# Altium project PowerCutMonitor-v1.1.PrjPcb (part 1 of 2)
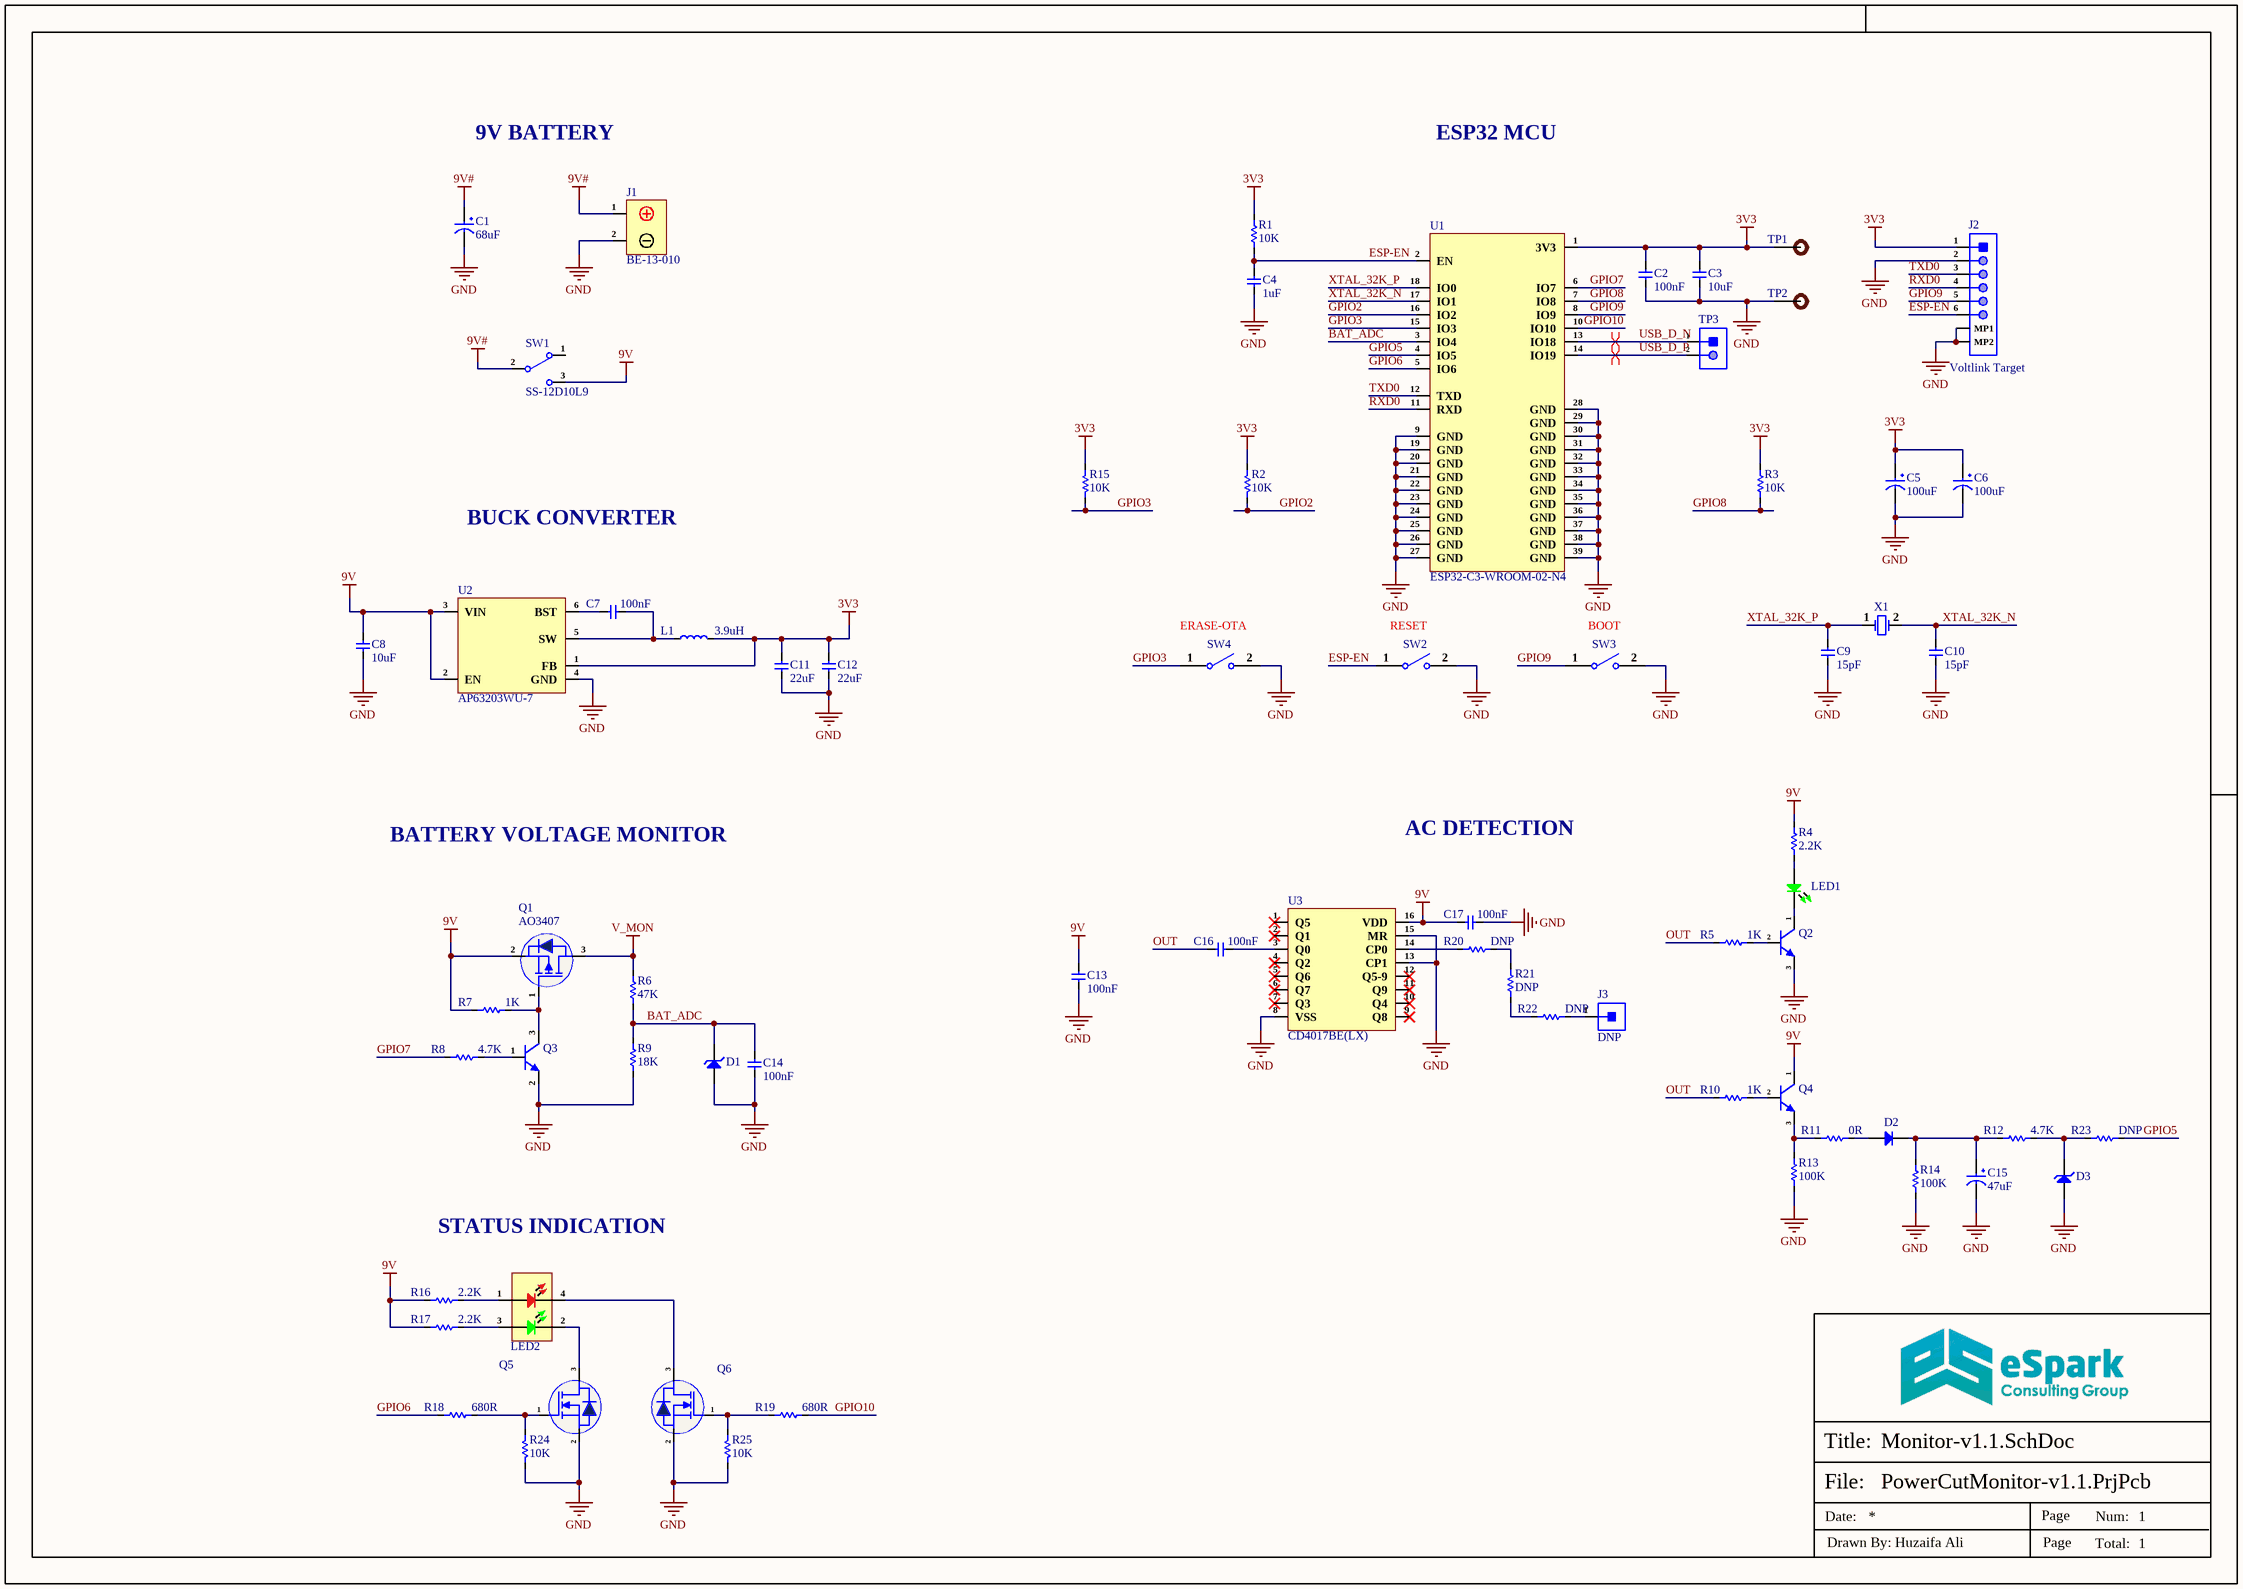
[diagram p0: Monitor-v1.1.SchDoc]
1 sheet, 68 parts. Net scope: global (net labels, ports and power ports of the same name join across sheets).
Board file: MonitorPCB-v1.1.PcbDoc

## Sheet Monitor-v1.1.SchDoc
size 420 x 297 mm; SheetNumber: 1; SheetTotal: 1

### Parts
C1  68uF  [Case-C]
C2  100nF  [cap-0402]
C3  10uF  [Cap-0402]
C4  1uF  [Cap-0402]
C5  100uF  [Case-B]
C6  100uF  [Case-B]
C7  100nF  [cap-0402]
C8  10uF  [Cap-1206]
C9  15pF  [Cap-0402]
C10  15pF  [Cap-0402]
C11  22uF  [Cap-0805]
C12  22uF  [Cap-0805]
C13  100nF  [cap-0402]
C14  100nF  [cap-0402]
C15  47uF  [Case-B]
C16  100nF  [cap-0402]
C17  100nF  [cap-0402]
D1  MM3Z3V3B  [SOD323F]  (value not drawn)
D2  1N4148WS-7-F  [SOD-323]  (value not drawn)
D3  MM3Z3V3B  [SOD323F]  (value not drawn)
J1  BE-13-010  [BE-13-010]
J2  Voltlink Target  [Voltlink Target]
J3  DNP  [HDR 1x1 TH Male]  (no BOM)
L1  3.9uH  [SWPA5020S3R9NT]
LED1  Emerald  [LED-0603]  (value not drawn)
LED2  A-SC6302R6AGHC-A03-2T  [A-SC6302R6AGHC-A03-2T]  (value not drawn)
Q1  AO3407  [SOT-23]
Q2  BC547BTA  [TO-92-3L]  (value not drawn)
Q3  MMBT3904M  [SOT-723]  (value not drawn)
Q4  BC547BTA  [TO-92-3L]  (value not drawn)
Q5  AO3400A  [sot-23]  (value not drawn)
Q6  AO3400A  [sot-23]  (value not drawn)
R1  10K  [Res-0402]
R2  10K  [Res-0402]
R3  10K  [Res-0402]
R4  2.2K  [Res-0402]
R5  1K  [Res-0402]
R6  47K  [Res-0402]
R7  1K  [Res-0402]
R8  4.7K  [Res-0402]
R9  18K  [Res-0402]
R10  1K  [Res-0402]
R11  0R  [Res-0402]  (no BOM)
R12  4.7K  [Res-0402]
R13  100K  [Res-0402]
R14  100K  [Res-0402]
R15  10K  [Res-0402]
R16  2.2K  [Res-0402]
R17  2.2K  [Res-0402]
R18  680R  [Res-0402]
R19  680R  [Res-0402]
R20  DNP  [Res-0402]  (no BOM)
R21  DNP  [Res-0402]  (no BOM)
R22  DNP  [Res-0402]  (no BOM)
R23  DNP  [Res-0402]  (no BOM)
R24  10K  [Res-0402]
R25  10K  [Res-0402]
SW1  SS-12D10L9  [SS-12D10L9]
SW2  B3U-1000P  [B3U-1000P]  (value not drawn)
SW3  B3U-1000P  [B3U-1000P]  (value not drawn)
SW4  B3U-1000P  [B3U-1000P]  (value not drawn)
TP1  TEST POINT 0.5mm Dia  [Test-point - 0.5mm]  (value not drawn)  (no BOM)
TP2  TEST POINT 0.5mm Dia  [Test-point - 0.5mm]  (value not drawn)  (no BOM)
TP3  2 Test Pad  [2 Test Pad]  (value not drawn)  (no BOM)
U1  ESP32-C3-WROOM-02-N4  [ESP32-C3-WROOM-02-N4]
U2  AP63203WU-7  [TSOT-23-6]
U3  CD4017BE(LX)  [DIP-16]
X1  Q13FC13500004  [SMD3215-2P]  (value not drawn)

### Nets
3V3: C2.2 C3.2 C5.1 C6.1 C11.2 C12.2 J2.1 L1.2 R1.2 R2.2 R3.2 R15.2 TP1.1 U1.1(3V3) U2.1(FB)
9V: C8.2 C13.2 C17.2 Q1.2(S) Q4.1(C) R4.2 R7.1 R16.1 R17.1 SW1.3 U2.2(EN) U2.3(VIN) U3.16(VDD)
9V#: C1.1 J1.1(+) SW1.2
GND: C1.2 C2.1 C3.1 C4.1 C5.2 C6.2 C8.1 C9.1 C10.1 C11.1 C12.1 C13.1 C14.1 C15.2 C17.1 D1.1(A) D3.1(A) J1.2(-) J2.2 J2.MP1 J2.MP2 Q2.3(E) Q3.2(E) Q5.2(S) Q6.2(S) R9.1 R13.1 R14.1 R24.1 R25.1 SW2.2 SW3.2 SW4.2 TP2.1 U1.9(GND) U1.19(GND) U1.20(GND) U1.21(GND) U1.22(GND) U1.23(GND) U1.24(GND) U1.25(GND) U1.26(GND) U1.27(GND) U1.28(GND) U1.29(GND) U1.30(GND) U1.31(GND) U1.32(GND) U1.33(GND) U1.34(GND) U1.35(GND) U1.36(GND) U1.37(GND) U1.38(GND) U1.39(GND) U2.4(GND) U3.8(VSS) U3.13(CP1) U3.15(MR)
V_MON: Q1.3(D) R6.2
BAT_ADC: C14.2 D1.2(K) R6.1 R9.2 U1.3(IO4)
ESP-EN: C4.2 J2.6 R1.1 SW2.1 U1.2(EN)
GPIO2: R2.1 U1.16(IO2)
GPIO3: R15.1 SW4.1 U1.15(IO3)
GPIO5: R23.2 U1.4(IO5)
GPIO6: R18.1 U1.5(IO6)
GPIO7: R8.1 U1.6(IO7)
GPIO8: R3.1 U1.7(IO8)
GPIO9: J2.5 SW3.1 U1.8(IO9)
GPIO10: R19.2 U1.10(IO10)
OUT: C16.2 R5.1 R10.1
RXD0: J2.4 U1.11(RXD)
TXD0: J2.3 U1.12(TXD)
USB_D_N: TP3.1 U1.13(IO18)
USB_D_P: TP3.2 U1.14(IO19)
XTAL_32K_N: C10.2 U1.17(IO1) X1.2(OSC2)
XTAL_32K_P: C9.2 U1.18(IO0) X1.1(OSC1)
NetC7_1: C7.1 L1.1 U2.5(SW)
NetC7_2: C7.2 U2.6(BST)
NetC15_1: C15.1 D2.1(K) R12.1 R14.2
NetC16_1: C16.1 U3.3(Q0)
NetD2_2: D2.2(A) R11.2
NetD3_2: D3.2(K) R12.2 R23.1
NetJ3_1: J3.1 R22.2
NetLED1_1: LED1.1 R4.1
NetLED1_2: LED1.2 Q2.1(C)
NetLED2_1: LED2.1 R16.2
NetLED2_2: LED2.2 Q5.3(D)
NetLED2_3: LED2.3 R17.2
NetLED2_4: LED2.4 Q6.3(D)
NetQ1_1: Q1.1(G) Q3.3(C) R7.2
NetQ2_2: Q2.2(B) R5.2
NetQ3_1: Q3.1(B) R8.2
NetQ4_2: Q4.2(B) R10.2
NetQ4_3: Q4.3(E) R11.1 R13.2
NetQ5_1: Q5.1(G) R18.2 R24.2
NetQ6_1: Q6.1(G) R19.1 R25.2
NetR20_1: R20.1 U3.14(CP0)
NetR20_2: R20.2 R21.2
NetR21_1: R21.1 R22.1

Not connected (* = marked no-connect by the designer): SW1 1; U3 1(Q5)* 2(Q1)* 4(Q2)* 5(Q6)* 6(Q7)* 7(Q3)* 9(Q8)* 10(Q4)* 11(Q9)* 12(Q5-9)*

### Layout directives
differential pair; net class USB_LINES: USB_D_N, USB_D_P

### Notes on the sheet
- 9V BATTERY
- ESP32 MCU
- BUCK CONVERTER
- (near SW4) ERASE-OTA
- (near SW2) RESET
- (near SW3) BOOT
- BATTERY VOLTAGE MONITOR
- AC DETECTION
- STATUS INDICATION
- File:
- Title:
- Date:
- Page
- Num:
- Total:
- Drawn By: Huzaifa Ali